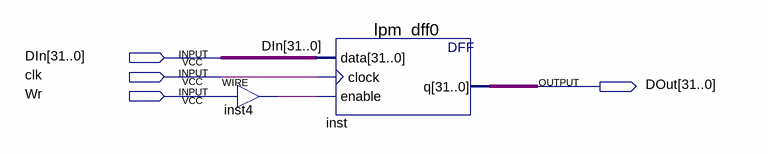
[diagram p0: schematic sheet]
// Quartus schematic lpm_dff.bdf as structural Verilog: 2 symbols, 4 pins
module lpm_dff (
  input  [31:0] DIn,
  input  clk,
  input  Wr,
  output [31:0] DOut
);

  wire inst4_out;

  assign inst4_out = Wr;  // WIRE inst4
  lpm_dff0 inst (.data(DIn), .clock(clk), .enable(inst4_out), .q(DOut));
endmodule
